# Altium schematic sheet DXES101B-659637-EXPANSION-BUS.SchDoc
size A3; Organization: Altium Limited; Address1: 3 Minna Close; Address2: Belrose; Address3: NSW 2085; Address4: Australia; SheetNumber: 9; SheetTotal: 10
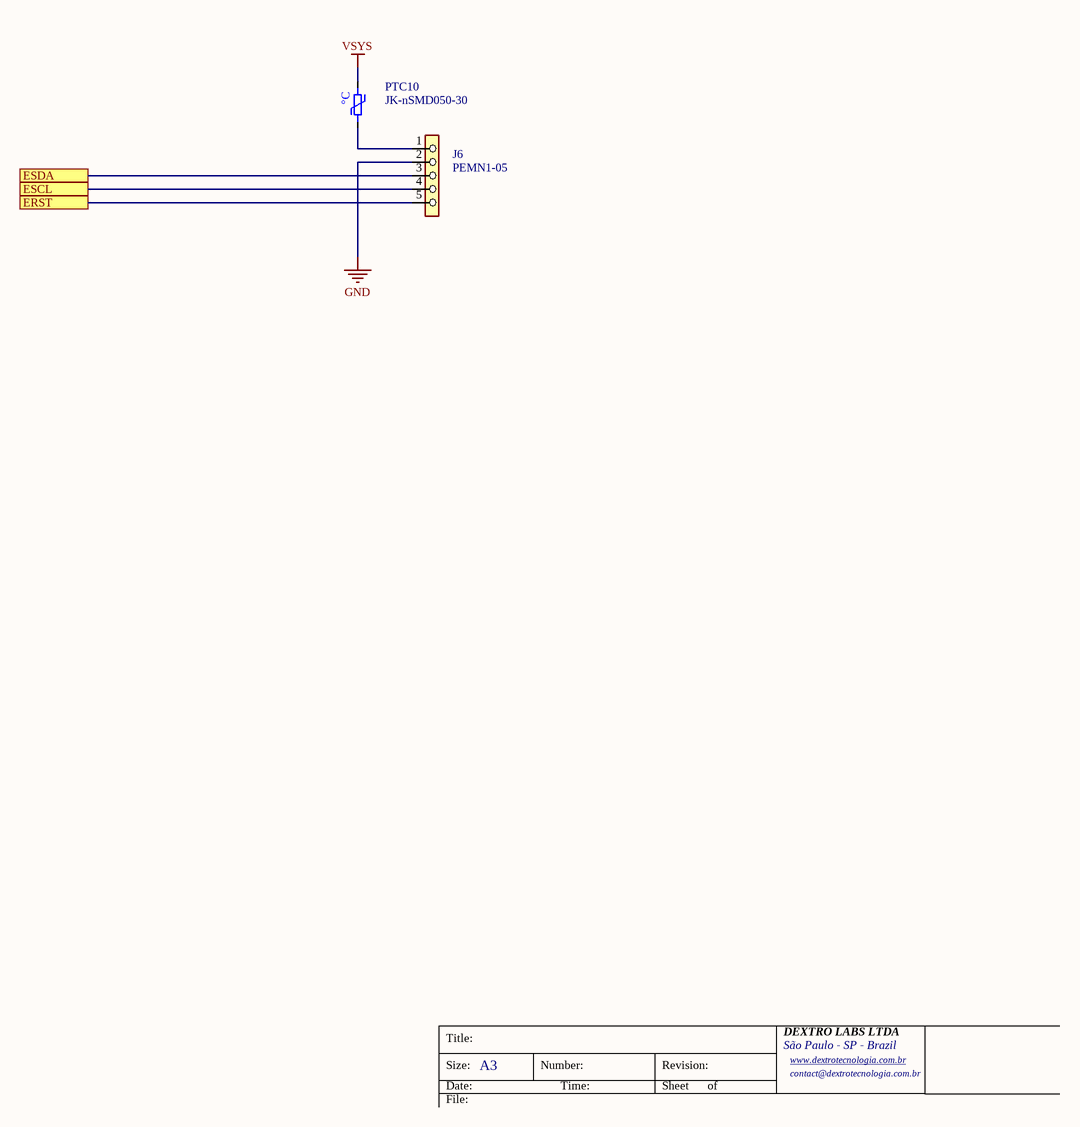
[diagram p0: DXES101B-659637-EXPANSION-BUS.SchDoc]

## Parts
J6  PEMN1-05  [PEMN1-05]
PTC10  JK-nSMD050-30  [PTC-1206]

## Ports
ERST (see DXES101B-659637-GENERAL[3C], DXES101B-659637-POWER-AND-SIGNALS[2C]), ESCL (see DXES101B-659637-GENERAL[3C], DXES101B-659637-POWER-AND-SIGNALS[3C]), ESDA (see DXES101B-659637-GENERAL[3C], DXES101B-659637-POWER-AND-SIGNALS[2C])

## Nets
GND: J6.2
VSYS: PTC10.2
ERST: J6.5 ; port ERST
ESCL: J6.4 ; port ESCL
ESDA: J6.3 ; port ESDA
NetJ6_1: J6.1 PTC10.1

## Notes on the sheet
- Title:
- Size:
- Date:
- A3
- Number:
- Time:
- Revision:
- Sheet
- of
- DEXTRO LABS LTDA
- São Paulo - SP - Brazil
- www.dextrotecnologia.com.br <http://www.dextrotecnologia.com.br>
- contact@dextrotecnologia.com.br
- File:
- (in symbol PTC-FUSE-30V-500mA-1206) °C

## Library data of the parts
J6 = PEMN1-05: Conector PTH passo 2,5mm - Montagem em placa - 90º - 250VCA - 3A - 10mOhms
PTC10 = PTC-FUSE-30V-500mA-1206: 30V 500mA 100A 1A 150mΩ 1206 PTC Resettable Fuses ROHS; LCSC: C720075